# EAGLE schematic esp32_servo_lcd_cam_v6 (EAGLE 9.7.0)
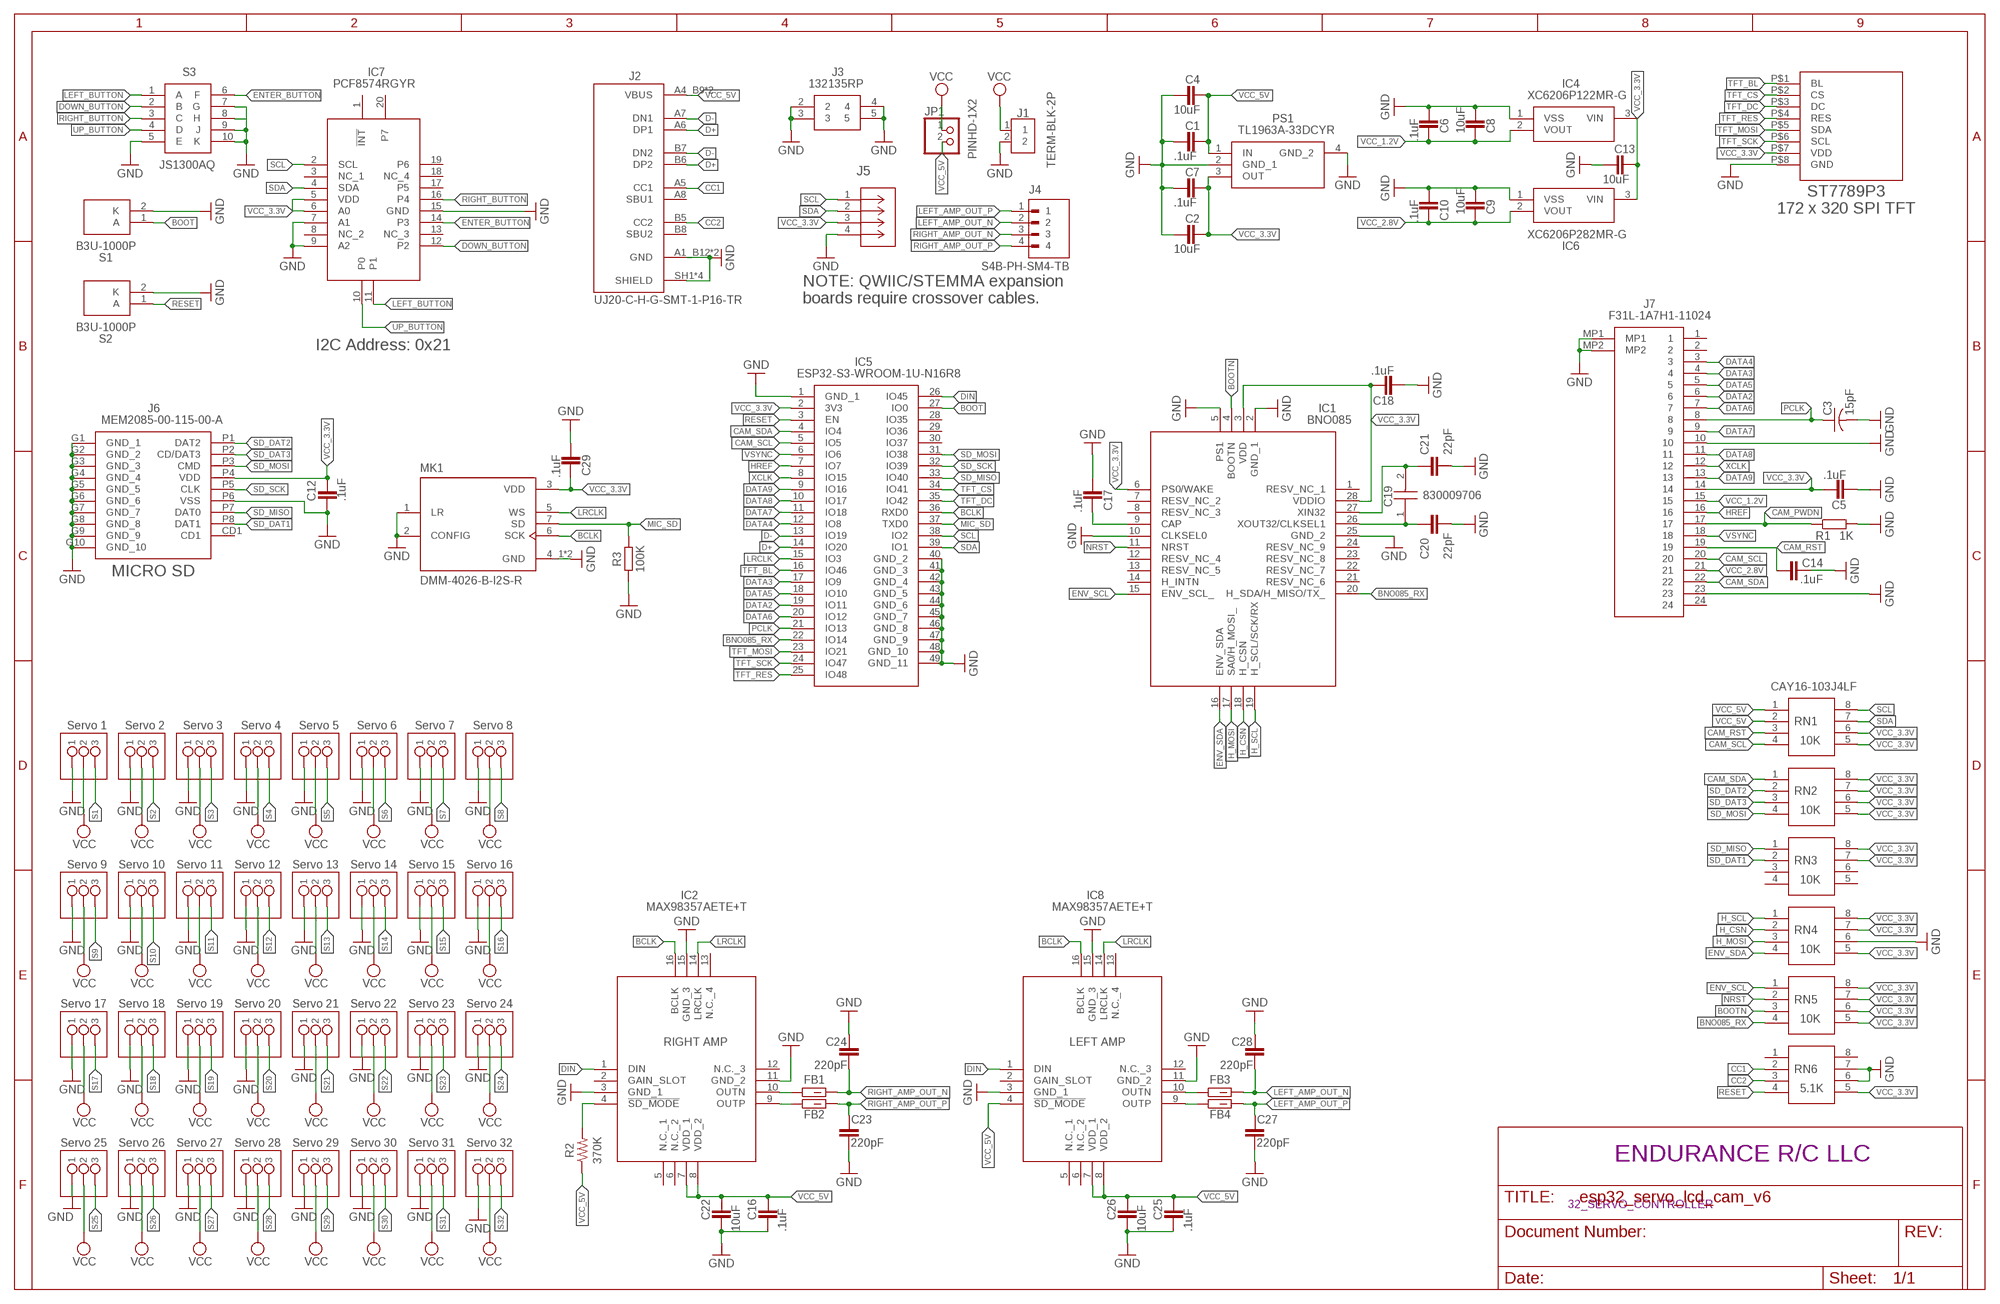
[diagram p0: schematic, sheet 1, part 1 of 2]
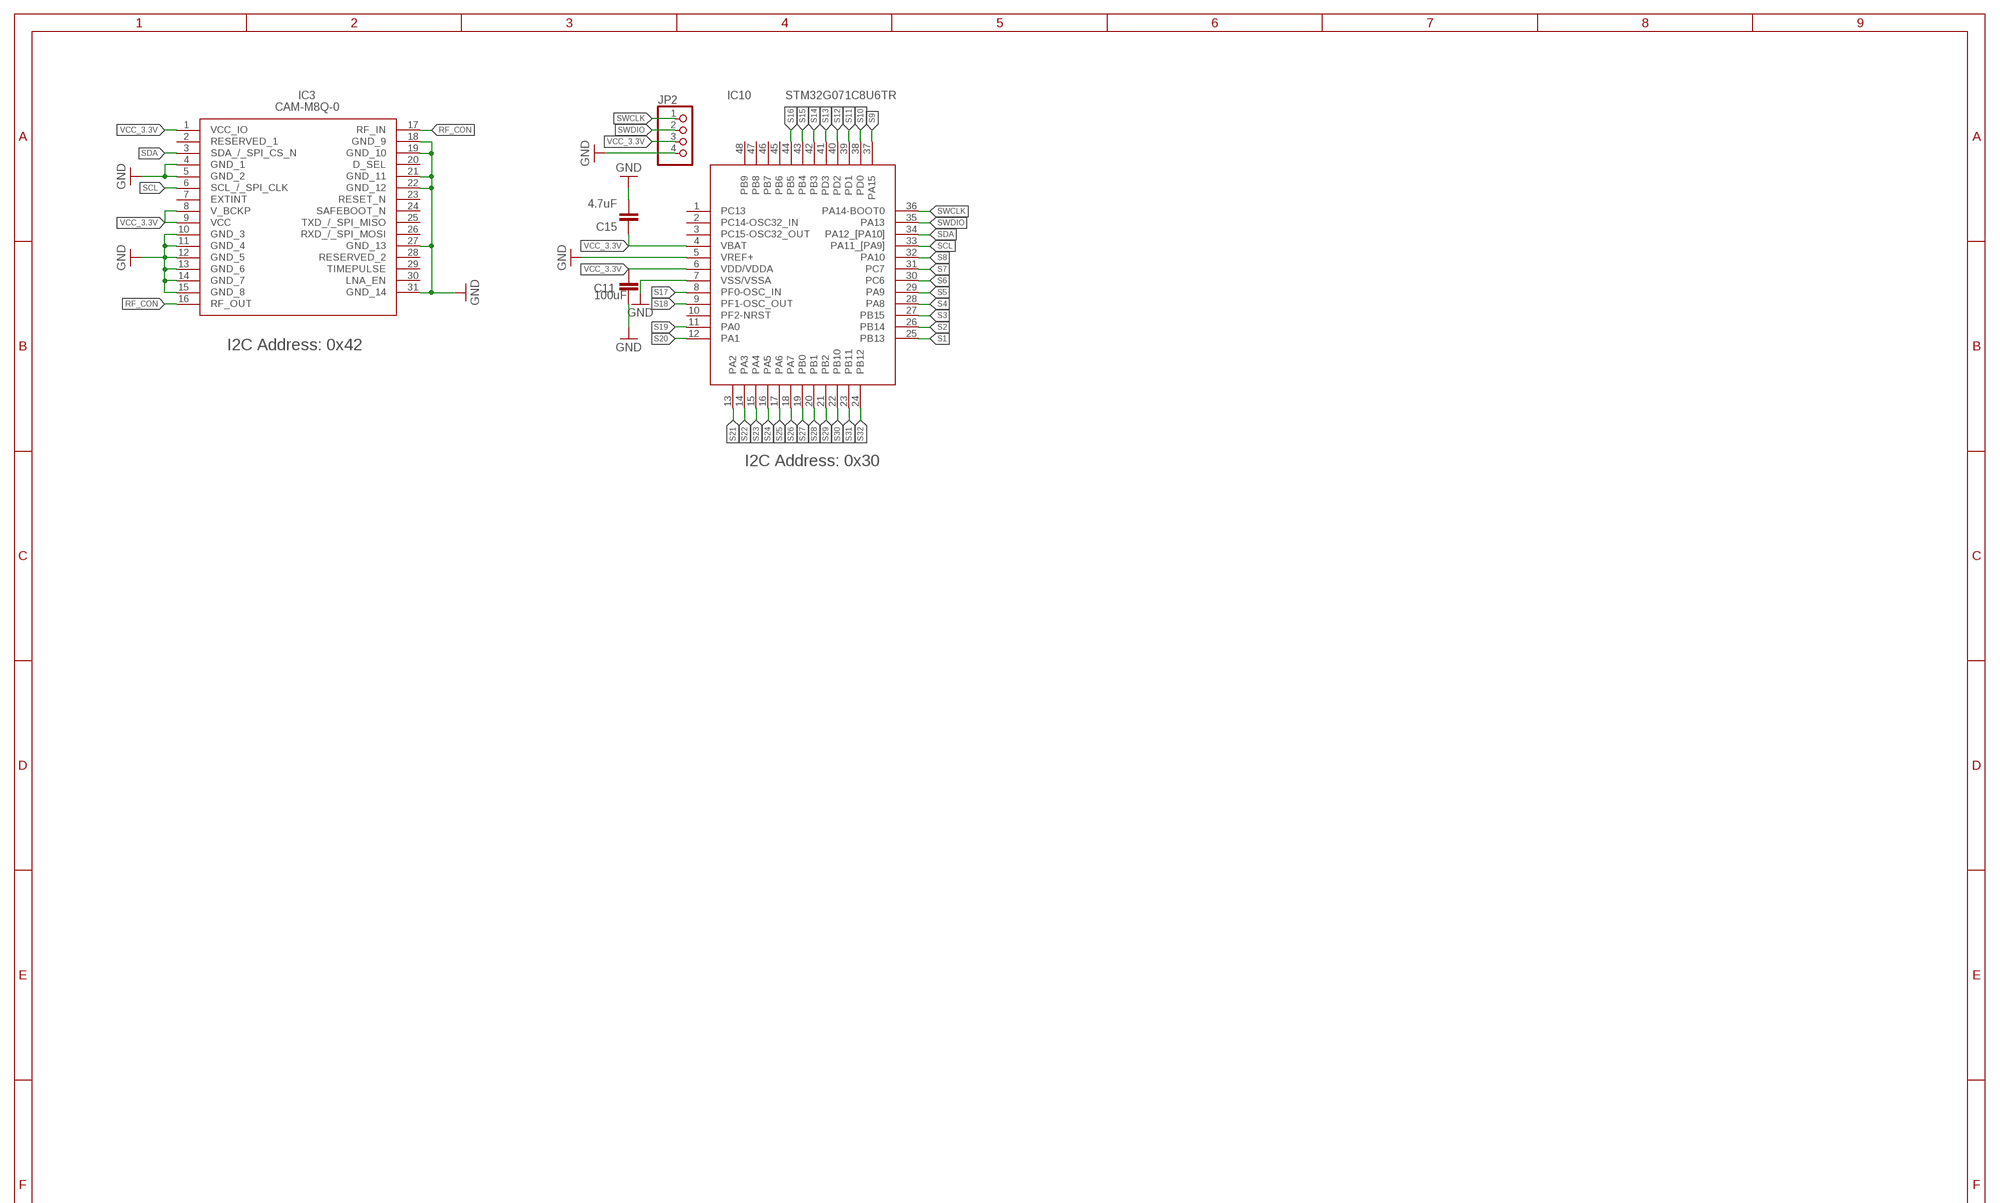
[diagram p1: schematic, sheet 1, part 2 of 2]
FRAME1 (FRAME_B_L): 32_SERVO_CONTROLLER: 1; ENDURANCE_RC_LLC: ENDURANCE R/C LLC
FRAME2 (FRAME_B_L): 32_SERVO_CONTROLLER: 1; ENDURANCE_RC_LLC: ENDURANCE R/C LLC

## Parts
C1  .1uF  CAPACITOR_CHIP-0504(1310-METRIC)  [CAPC1110X102]
C2  10uF  CAPACITOR_CHIP-0504(1310-METRIC)  [CAPC1110X102]
C3  15pF  C-US_CHIP-0805(2012-METRIC)  [CAPC2012X110]
C4  10uF  CAPACITOR_CHIP-0504(1310-METRIC)  [CAPC1110X102]
C5  .1uF  CAPACITOR_CHIP-0504(1310-METRIC)  [CAPC1110X102]
C6  .1uF  CAPACITOR_CHIP-0504(1310-METRIC)  [CAPC1110X102]
C7  .1uF  CAPACITOR_CHIP-0504(1310-METRIC)  [CAPC1110X102]
C8  10uF  CAPACITOR_CHIP-0504(1310-METRIC)  [CAPC1110X102]
C9  10uF  CAPACITOR_CHIP-0504(1310-METRIC)  [CAPC1110X102]
C10  .1uF  CAPACITOR_CHIP-0504(1310-METRIC)  [CAPC1110X102]
C11  100uF  CAPACITOR_CHIP-1210(3225-METRIC)  [CAPC3225X135]
C12  .1uF  CAPACITOR_CHIP-0504(1310-METRIC)  [CAPC1110X102]
C13  10uF  CAPACITOR_CHIP-0504(1310-METRIC)  [CAPC1110X102]
C14  .1uF  CAPACITOR_CHIP-0504(1310-METRIC)  [CAPC1110X102]
C15  4.7uF  C_CHIP-0402(1005-METRIC)  [CAPC1005X60]
C16  .1uF  CAPACITOR_CHIP-0504(1310-METRIC)  [CAPC1110X102]
C17  .1uF  CAPACITOR_CHIP-0504(1310-METRIC)  [CAPC1110X102]
C18  .1uF  CAPACITOR_CHIP-0504(1310-METRIC)  [CAPC1110X102]
C19  830009706  [830009706]
C20  22pF  C_CHIP-0402(1005-METRIC)  [CAPC1005X60]
C21  22pF  C_CHIP-0402(1005-METRIC)  [CAPC1005X60]
C22  10uF  CAPACITOR_CHIP-0504(1310-METRIC)  [CAPC1110X102]
C23  220pF  C_CHIP-0402(1005-METRIC)  [CAPC1005X60]
C24  220pF  C_CHIP-0402(1005-METRIC)  [CAPC1005X60]
C25  .1uF  CAPACITOR_CHIP-0504(1310-METRIC)  [CAPC1110X102]
C26  10uF  CAPACITOR_CHIP-0504(1310-METRIC)  [CAPC1110X102]
C27  220pF  C_CHIP-0402(1005-METRIC)  [CAPC1005X60]
C28  220pF  C_CHIP-0402(1005-METRIC)  [CAPC1005X60]
C29  .1uF  CAPACITOR_CHIP-0504(1310-METRIC)  [CAPC1110X102]
FB1  LM18AG601  FB_BLM18AG601SN1D_0603(1608)  [BEADC1608X95N]
FB2  LM18AG601  FB_BLM18AG601SN1D_0603(1608)  [BEADC1608X95N]
FB3  LM18AG601  FB_BLM18AG601SN1D_0603(1608)  [BEADC1608X95N]
FB4  LM18AG601  FB_BLM18AG601SN1D_0603(1608)  [BEADC1608X95N]
IC1  BNO085  [BNO085]
IC2  MAX98357AETE+T  [QFN50P300X300X80-17N]
IC3  CAM-M8Q-0  [CAMM8Q0]
IC4  XC6206P122MR-G  [SOT95P280X130-3N]
IC5  ESP32-S3-WROOM-1U-N16R8  [ESP32S3WROOM1UN16R8]
IC6  XC6206P282MR-G  [SOT95P280X130-3N]
IC7  PCF8574RGYR  [SN74CB3Q3244RGYR]
IC8  MAX98357AETE+T  [QFN50P300X300X80-17N]
IC10  STM32G071C8U6TR  [QFN50P700X700X65-49N]
J1  TERM-BLK-2P  2828XX-2282837-2  [TERMBLK_508-2N]
J2  UJ20-C-H-G-SMT-1-P16-TR  [SAMESKY_UJ20-C-H-G-SMT-1-P16-TR]
J3  132135RP  [132135RP]
J4  S4B-PH-SM4-TB  [JST_S4B-PH-SM4-TB]
J5  SM04B-SRSS-TBCONN_SM04B-SRSS-TB_JST  [CONN_SM04B-SRSS-TB_JST]
J6  MEM2085-00-115-00-A  [MEM20850011500A]
J7  F31L-1A7H1-11024  [F31L1A7H111024]
JP1  PINHD-1X2  [1X02]
JP2  PINHD-1X4  [1X04]
MK1  DMM-4026-B-I2S-R  [MIC_DMM-4026-B-I2S-R]
PS1  TL1963A-33DCYR  [SOT230P700X180-4N]
R1  1K  R_CHIP-0603(1608-METRIC)  [RESC1608X60]
R2  370K  R-US_CHIP-0603(1608-METRIC)  [RESC1608X60]
R3  100K  R_CHIP-0402(1005-METRIC)  [RESC1005X40]
RN1  CAY16-103J4LF  [CAY16151J4LF]
RN2  CAY16-103J4LF  [CAY16151J4LF]
RN3  CAY16-103J4LF  [CAY16151J4LF]
RN4  CAY16-103J4LF  [CAY16151J4LF]
RN5  CAY16-103J4LF  [CAY16151J4LF]
RN6  CAY16-103J4LF  [CAY16151J4LF]
S1  B3U-1000P  [B3U-1000P]
S2  B3U-1000P  [B3U-1000P]
S3  JS1300AQ  [JS1300]
U$1  Servo 6  PINHD-1X03_1X03M  [1X03]
U$2  Servo 7  PINHD-1X03_1X03M  [1X03]
U$3  Servo 8  PINHD-1X03_1X03M  [1X03]
U$4  Servo 9  PINHD-1X03_1X03M  [1X03]
U$5  Servo 10  PINHD-1X03_1X03M  [1X03]
U$6  Servo 11  PINHD-1X03_1X03M  [1X03]
U$7  Servo 12  PINHD-1X03_1X03M  [1X03]
U$8  Servo 13  PINHD-1X03_1X03M  [1X03]
U$9  Servo 14  PINHD-1X03_1X03M  [1X03]
U$10  Servo 15  PINHD-1X03_1X03M  [1X03]
U$11  Servo 4  PINHD-1X03_1X03M  [1X03]
U$12  Servo 5  PINHD-1X03_1X03M  [1X03]
U$13  Servo 1  PINHD-1X03_1X03M  [1X03]
U$14  Servo 3  PINHD-1X03_1X03M  [1X03]
U$15  Servo 2  PINHD-1X03_1X03M  [1X03]
U$16  Servo 16  PINHD-1X03_1X03M  [1X03]
U$17  Servo 17  PINHD-1X03_1X03M  [1X03]
U$18  Servo 18  PINHD-1X03_1X03M  [1X03]
U$19  Servo 19  PINHD-1X03_1X03M  [1X03]
U$20  Servo 21  PINHD-1X03_1X03M  [1X03]
U$21  Servo 20  PINHD-1X03_1X03M  [1X03]
U$22  Servo 22  PINHD-1X03_1X03M  [1X03]
U$23  Servo 23  PINHD-1X03_1X03M  [1X03]
U$24  Servo 24  PINHD-1X03_1X03M  [1X03]
U$25  Servo 25  PINHD-1X03_1X03M  [1X03]
U$26  Servo 26  PINHD-1X03_1X03M  [1X03]
U$27  Servo 27  PINHD-1X03_1X03M  [1X03]
U$28  Servo 28  PINHD-1X03_1X03M  [1X03]
U$29  Servo 29  PINHD-1X03_1X03M  [1X03]
U$30  Servo 30  PINHD-1X03_1X03M  [1X03]
U$31  Servo 31  PINHD-1X03_1X03M  [1X03]
U$32  Servo 32  PINHD-1X03_1X03M  [1X03]
U$33  1.47_IN_TFT_172_320_ST7789P3  [1.47_IN_TFT_172_320_ST7789P3]

## Nets
BCLK: IC2.16(BCLK) IC5.36(RXD0) IC8.16(BCLK) MK1.6(SCK)
BNO085_RX: IC1.20(H_SDA/H_MISO/TX_) IC5.22(IO14) RN5.4
BOOT: IC5.27(IO0) S1.1(A)
BOOTN: IC1.4(BOOTN) RN5.3
CAM_PWDN: J7.17 R1.1
CAM_RST: C14.1 J7.19 RN1.3
CAM_SCL: IC5.5(IO5) J7.20 RN1.4
CAM_SDA: IC5.4(IO4) J7.22 RN2.1
CC1: J2.A5(CC1) RN6.2
CC2: J2.B5(CC2) RN6.3
D+: IC5.14(IO20) J2.A6(DP1) J2.B6(DP2)
D-: IC5.13(IO19) J2.A7(DN1) J2.B7(DN2)
DATA2: IC5.19(IO11) J7.6
DATA3: IC5.17(IO9) J7.4
DATA4: IC5.12(IO8) J7.3
DATA5: IC5.18(IO10) J7.5
DATA6: IC5.20(IO12) J7.7
DATA7: IC5.11(IO18) J7.9
DATA8: IC5.10(IO17) J7.11
DATA9: IC5.9(IO16) J7.13
DIN: IC2.1(DIN) IC5.26(IO45) IC8.1(DIN)
DOWN_BUTTON: IC7.12(P2) S3.2(B)
ENTER_BUTTON: IC7.14(P3) S3.6(F)
ENV_SCL: IC1.15(ENV_SCL_) RN5.1
ENV_SDA: IC1.16(ENV_SDA) RN4.4
GND: C1.2 C2.2 C3.2 C4.2 C5.2 C6.2 C7.2 C8.2 C9.2 C10.2 C11.2 C12.2 C13.2 C14.2 C15.2 C16.2 C17.2 C18.2 C20.2 C21.2 C22.2 C23.2 C24.2 C25.2 C26.2 C27.2 C28.2 C29.2 IC1.2(GND_1) IC1.5(PS1) IC1.10(CLKSEL0) IC1.25(GND_2) IC2.3(GND_1) IC2.11(GND_2) IC2.15(GND_3) IC3.4(GND_1) IC3.5(GND_2) IC3.10(GND_3) IC3.11(GND_4) IC3.12(GND_5) IC3.13(GND_6) IC3.14(GND_7) IC3.15(GND_8) IC3.18(GND_9) IC3.19(GND_10) IC3.21(GND_11) IC3.22(GND_12) IC3.27(GND_13) IC3.31(GND_14) IC4.1(VSS) IC5.1(GND_1) IC5.40(GND_2) IC5.41(GND_3) IC5.42(GND_4) IC5.43(GND_5) IC5.44(GND_6) IC5.45(GND_7) IC5.46(GND_8) IC5.47(GND_9) IC5.48(GND_10) IC5.49(GND_11) IC6.1(VSS) IC7.7(A1) IC7.9(A2) IC7.15(GND) IC8.3(GND_1) IC8.11(GND_2) IC8.15(GND_3) IC10.5(VREF+) IC10.7(VSS/VSSA) J1.2 J2.A1_B12(GND) J2.B1_A12(GND) J2.SH1(SHIELD) J2.SH2(SHIELD) J2.SH3(SHIELD) J2.SH4(SHIELD) J3.2 J3.3 J3.4 J3.5 J5.4 J6.G1(GND_1) J6.G2(GND_2) J6.G3(GND_3) J6.G4(GND_4) J6.G5(GND_5) J6.G6(GND_6) J6.G7(GND_7) J6.G8(GND_8) J6.G9(GND_9) J6.G10(GND_10) J6.P6(VSS) J7.10 J7.23 J7.MP1 J7.MP2 JP2.4 MK1.1(LR) MK1.2(CONFIG) MK1.4_1(GND) MK1.4_2(GND) PS1.2(GND_1) PS1.4(GND_2) R1.2 R3.1 RN4.6 RN6.6 RN6.7 S1.2(K) S2.2(K) S3.5(E) S3.7(G) S3.8(H) S3.9(J) S3.10(K) U$1.1 U$2.1 U$3.1 U$4.1 U$5.1 U$6.1 U$7.1 U$8.1 U$9.1 U$10.1 U$11.1 U$12.1 U$13.1 U$14.1 U$15.1 U$16.1 U$17.1 U$18.1 U$19.1 U$20.1 U$21.1 U$22.1 U$23.1 U$24.1 U$25.1 U$26.1 U$27.1 U$28.1 U$29.1 U$30.1 U$31.1 U$32.1 U$33.P$8(GND)
H_CSN: IC1.18(H_CSN) RN4.2
H_MOSI: IC1.17(SA0/H_MOSI_) RN4.3
H_SCL: IC1.19(H_SCL/SCK/RX) RN4.1
HREF: IC5.7(IO7) J7.16
LEFT_AMP_OUT_N: C28.1 FB3.2 J4.2
LEFT_AMP_OUT_P: C27.1 FB4.2 J4.1
LEFT_BUTTON: IC7.11(P1) S3.1(A)
LRCLK: IC2.14(LRCLK) IC5.15(IO3) IC8.14(LRCLK) MK1.5(WS)
MIC_SD: IC5.37(TXD0) MK1.7(SD) R3.2
N$2: FB3.1 IC8.10(OUTN)
N$3: FB4.1 IC8.9(OUTP)
N$5: IC2.4(!SD_MODE) R2.2
N$7: FB1.1 IC2.10(OUTN)
N$8: FB2.1 IC2.9(OUTP)
N$12: C17.1 IC1.9(CAP)
N$13: C19.2 C21.1 IC1.27(XIN32)
N$14: C19.1 C20.1 IC1.26(XOUT32/CLKSEL1)
NRST: IC1.11(NRST) RN5.2
PCLK: C3.1 IC5.21(IO13) J7.8
RESET: IC5.3(EN) RN6.4 S2.1(A)
RF_CON: IC3.16(RF_OUT) IC3.17(RF_IN)
RIGHT_AMP_OUT_N: C24.1 FB1.2 J4.3
RIGHT_AMP_OUT_P: C23.1 FB2.2 J4.4
RIGHT_BUTTON: IC7.16(P4) S3.3(C)
S1: IC10.25(PB13) U$13.3
S2: IC10.26(PB14) U$15.3
S3: IC10.27(PB15) U$14.3
S4: IC10.28(PA8) U$11.3
S5: IC10.29(PA9) U$12.3
S6: IC10.30(PC6) U$1.3
S7: IC10.31(PC7) U$2.3
S8: IC10.32(PA10) U$3.3
S9: IC10.37(PA15) U$4.3
S10: IC10.38(PD0) U$5.3
S11: IC10.39(PD1) U$6.3
S12: IC10.40(PD2) U$7.3
S13: IC10.41(PD3) U$8.3
S14: IC10.42(PB3) U$9.3
S15: IC10.43(PB4) U$10.3
S16: IC10.44(PB5) U$16.3
S17: IC10.8(PF0-OSC_IN) U$17.3
S18: IC10.9(PF1-OSC_OUT) U$18.3
S19: IC10.11(PA0) U$19.3
S20: IC10.12(PA1) U$21.3
S21: IC10.13(PA2) U$20.3
S22: IC10.14(PA3) U$22.3
S23: IC10.15(PA4) U$23.3
S24: IC10.16(PA5) U$24.3
S25: IC10.17(PA6) U$25.3
S26: IC10.18(PA7) U$26.3
S27: IC10.19(PB0) U$27.3
S28: IC10.20(PB1) U$28.3
S29: IC10.21(PB2) U$29.3
S30: IC10.22(PB10) U$30.3
S31: IC10.23(PB11) U$31.3
S32: IC10.24(PB12) U$32.3
SCL: IC3.6(SCL_/_SPI_CLK) IC5.38(IO2) IC7.2(SCL) IC10.33(PA11_[PA9]) J5.1 RN1.8
SD_DAT1: J6.P8(DAT1) RN3.2
SD_DAT2: J6.P1(DAT2) RN2.2
SD_DAT3: J6.P2(CD/DAT3) RN2.3
SD_MISO: IC5.33(IO40) J6.P7(DAT0) RN3.1
SD_MOSI: IC5.31(IO38) J6.P3(CMD) RN2.4
SD_SCK: IC5.32(IO39) J6.P5(CLK)
SDA: IC3.3(SDA_/_SPI_CS_N) IC5.39(IO1) IC7.4(SDA) IC10.34(PA12_[PA10]) J5.2 RN1.7
SWCLK: IC10.36(PA14-BOOT0) JP2.1
SWDIO: IC10.35(PA13) JP2.2
TFT_BL: IC5.16(IO46) U$33.P$1(BL)
TFT_CS: IC5.34(IO41) U$33.P$2(CS)
TFT_DC: IC5.35(IO42) U$33.P$3(DC)
TFT_MOSI: IC5.23(IO21) U$33.P$5(SDA)
TFT_RES: IC5.25(IO48) U$33.P$4(RES)
TFT_SCK: IC5.24(IO47) U$33.P$6(SCL)
UP_BUTTON: IC7.10(P0) S3.4(D)
VCC: J1.1 JP1.1 U$1.2 U$2.2 U$3.2 U$4.2 U$5.2 U$6.2 U$7.2 U$8.2 U$9.2 U$10.2 U$11.2 U$12.2 U$13.2 U$14.2 U$15.2 U$16.2 U$17.2 U$18.2 U$19.2 U$20.2 U$21.2 U$22.2 U$23.2 U$24.2 U$25.2 U$26.2 U$27.2 U$28.2 U$29.2 U$30.2 U$31.2 U$32.2
VCC_1.2V: C6.1 C8.1 IC4.2(VOUT) J7.15
VCC_2.8V: C9.1 C10.1 IC6.2(VOUT) J7.21
VCC_3.3V: C2.1 C5.1 C7.1 C11.1 C12.1 C13.1 C15.1 C18.1 C29.1 IC1.3(VDD) IC1.6(PS0/WAKE) IC1.28(VDDIO) IC3.1(VCC_IO) IC3.8(V_BCKP) IC3.9(VCC) IC4.3(VIN) IC5.2(3V3) IC6.3(VIN) IC7.5(VDD) IC7.6(A0) IC10.4(VBAT) IC10.6(VDD/VDDA) J5.3 J6.P4(VDD) J7.14 JP2.3 MK1.3(VDD) PS1.3(OUT) RN1.5 RN1.6 RN2.5 RN2.6 RN2.7 RN2.8 RN3.7 RN3.8 RN4.5 RN4.7 RN4.8 RN5.5 RN5.6 RN5.7 RN5.8 RN6.5 U$33.P$7(VDD)
VCC_5V: C1.1 C4.1 C16.1 C22.1 C25.1 C26.1 IC2.7(VDD_1) IC2.8(VDD_2) IC8.4(!SD_MODE) IC8.7(VDD_1) IC8.8(VDD_2) J2.A4_B9(VBUS) J2.B4_A9(VBUS) JP1.2 PS1.1(IN) R2.1 RN1.1 RN1.2
VSYNC: IC5.6(IO6) J7.18
XCLK: IC5.8(IO15) J7.12
Unconnected: IC1.1(RESV_NC_1) IC1.7(RESV_NC_2) IC1.8(RESV_NC_3) IC1.12(RESV_NC_4) IC1.13(RESV_NC_5) IC1.14(H_INTN) IC1.21(RESV_NC_6) IC1.22(RESV_NC_7) IC1.23(RESV_NC_8) IC1.24(RESV_NC_9) IC2.2(GAIN_SLOT) IC2.5(N.C._1) IC2.6(N.C._2) IC2.12(N.C._3) IC2.13(N.C._4) IC3.2(RESERVED_1) IC3.7(EXTINT) IC3.20(D_SEL) IC3.23(RESET_N) IC3.24(SAFEBOOT_N) IC3.25(TXD_/_SPI_MISO) IC3.26(RXD_/_SPI_MOSI) IC3.28(RESERVED_2) IC3.29(TIMEPULSE) IC3.30(LNA_EN) IC5.28(IO35) IC5.29(IO36) IC5.30(IO37) IC7.1(!INT) IC7.3(NC_1) IC7.8(NC_2) IC7.13(NC_3) IC7.17(P5) IC7.18(NC_4) IC7.19(P6) IC7.20(P7) IC8.2(GAIN_SLOT) IC8.5(N.C._1) IC8.6(N.C._2) IC8.12(N.C._3) IC8.13(N.C._4) IC10.1(PC13) IC10.2(PC14-OSC32_IN) IC10.3(PC15-OSC32_OUT) IC10.10(PF2-NRST) IC10.45(PB6) IC10.46(PB7) IC10.47(PB8) IC10.48(PB9) J2.A8(SBU1) J2.B8(SBU2) J6.CD1 J7.1 J7.2 J7.24 RN3.3 RN3.4 RN3.5 RN3.6 RN6.1 RN6.8

## Notes on the sheet
- ST7789P3
  172 x 320 SPI TFT
- NOTE: QWIIC/STEMMA expansion
  boards require crossover cables.
- I2C Address: 0x21
- MICRO SD
- 10K
- 10K
- 10K
- 10K
- 10K
- RIGHT AMP | LEFT AMP
- 5.1K
- I2C Address: 0x42
- I2C Address: 0x30

## Library data of the parts
C1 C2 C4-C14 C16-C18 C22 C25 C26 C29 = Tinkercad:CAPACITOR: Capacitor - Generic; CATEGORY: Capacitor
C3 = Capacitor:C-US: Capacitor - ANSI; CATEGORY: Capacitor
C15 C20 C21 C23 C24 C27 C28 = Capacitor:C: Capacitor - Generic; CATEGORY: Capacitor
C19 = 830009706:830009706: WE-XTAL Quartz Crystal CFPX-217; 3.2 x 1.5mm; 32.7680 kHz; Tol = +/-20 ppm; Stab = +/-- ppm Load Cap = 9 pF; Source: Datasheet <https://www.we-online.com/catalog/datasheet/830009706.pdf>; DESCRIPTION: WE-XTAL Quartz Crystal CFPX-217; 3.2 x 1.5mm; 32.7680 kHz; Tol = +/-20 ppm; Stab = +/-- ppm Load Cap = 9 pF;; HEIGHT: 0.9mm; MANUFACTURER_NAME: Wurth Elektronik; MANUFACTURER_PART_NUMBER: 830009706; MOUSER_PART_NUMBER: 710-830009706; MOUSER_PRICE-STOCK: https://www.mouser.co.uk/ProductDetail/Wurth-Elektronik/830009706?qs=2WXlatMagcFmeMIz1Bq3%2Fg%3D%3D
FB1-FB4 = Filter:FB_: Ferrite Bead - Popular parts; CATEGORY: Filter; DESCRIPTION: FERRITE BEAD 600 OHM 0603 1LN; MANUFACTURER: Murata Electronics; SUB-CATEGORY: Ferrite bead
IC1 = BNO085:BNO085: Board Mount Motion & Position Sensors 9-axis IMU Source: Datasheet <https://www.ceva-dsp.com/wp-content/uploads/2019/10/BNO080_085-Datasheet.pdf>; DESCRIPTION: Board Mount Motion & Position Sensors 9-axis IMU; HEIGHT: 1.18mm; MANUFACTURER_NAME: CEVA; MANUFACTURER_PART_NUMBER: BNO085; MOUSER_PART_NUMBER: 526-BNO085; MOUSER_PRICE-STOCK: https://www.mouser.co.uk/ProductDetail/CEVA/BNO085?qs=ulEaXIWI0c9BFVeZDQCmmQ%3D%3D
IC2 IC8 = MAX98357AETE+T:MAX98357AETE+T: Audio Amplifiers Digital Input Class D Amplifier Source: Datasheet <https://datasheets.maximintegrated.com/en/ds/MAX98357A-MAX98357B.pdf>; DESCRIPTION: Audio Amplifiers Digital Input Class D Amplifier; HEIGHT: 0.8mm; MANUFACTURER_NAME: Analog Devices; MANUFACTURER_PART_NUMBER: MAX98357AETE+T; MOUSER_PART_NUMBER: 700-MAX98357AETE+T; MOUSER_PRICE-STOCK: https://www.mouser.co.uk/ProductDetail/Analog-Devices-Maxim-Integrated/MAX98357AETE%2bT?qs=AAveGqk956HhNpoJjF5x2g%3D%3D
IC3 = CAM-M8Q-0:CAM-M8Q-0: CAM-M8 RF Receiver BeiDou, GLONASS, GNSS, GPS, QZSS 1.575GHz -167dBm On-Board, Chip Module Source: Datasheet <https://content.u-blox.com/sites/default/files/CAM-M8-FW3_DataSheet_(UBX-15031574).pdf>; DESCRIPTION: CAM-M8 RF Receiver BeiDou, GLONASS, GNSS, GPS, QZSS 1.575GHz -167dBm On-Board, Chip Module; HEIGHT: 2.3mm; MANUFACTURER_NAME: u-blox; MANUFACTURER_PART_NUMBER: CAM-M8Q-0; MOUSER_PART_NUMBER: 377-CAM-M8Q-0; MOUSER_PRICE-STOCK: https://www.mouser.co.uk/ProductDetail/u-blox/CAM-M8Q-0?qs=vEM7xhTegWgOVMjXYnonQA%3D%3D
IC4 = XC6206P122MR-G:XC6206P122MR-G: LDO Voltage Regulators 1uA Low Quiescent 3 Terminal, Low ESR Cap. Compatible, Voltage Regulator Source: Datasheet <https://www.torexsemi.com/file/xc6206/XC6206.pdf>; DESCRIPTION: LDO Voltage Regulators 1uA Low Quiescent 3 Terminal, Low ESR Cap. Compatible, Voltage Regulator; HEIGHT: 1.3mm; MANUFACTURER_NAME: Torex; MANUFACTURER_PART_NUMBER: XC6206P122MR-G; MOUSER_PART_NUMBER: 865-XC6206P122MR-G; MOUSER_PRICE-STOCK: https://www.mouser.co.uk/ProductDetail/Torex-Semiconductor/XC6206P122MR-G?qs=AsjdqWjXhJ%2F35%2FU%2FZk2JYg%3D%3D
IC5 = ESP32-S3-WROOM-1U-N16R8:ESP32-S3-WROOM-1U-N16R8: WiFi Modules - 802.11 [Engineering Samples] SMD Module, ESP32-S3R8, 8 MB Octal PSRAM Die, 16 MB Quad SPI Flash, IPEX Antenna Connector Source: Datasheet <https://www.espressif.com/sites/default/files/documentation/esp32-s3-wroom-1_wroom-1u_datasheet_en.pdf>; DESCRIPTION: WiFi Modules - 802.11 [Engineering Samples] SMD Module, ESP32-S3R8, 8 MB Octal PSRAM Die, 16 MB Quad SPI Flash, IPEX Antenna Connector; HEIGHT: 3.35mm; MANUFACTURER_NAME: Espressif Systems; MANUFACTURER_PART_NUMBER: ESP32-S3-WROOM-1U-N16R8; MOUSER_PART_NUMBER: 356-ESP32S3WM1UN16R8; MOUSER_PRICE-STOCK: https://www.mouser.co.uk/ProductDetail/Espressif-Systems/ESP32-S3-WROOM-1U-N16R8?qs=Li%252BoUPsLEns6V0Pr5KRJtw%3D%3D
IC6 = XC6206P282MR-G:XC6206P282MR-G: LDO Voltage Regulators 1uA Low Quiescent 3 Terminal, Low ESR Cap. Compatible, Voltage Regulator Source: Datasheet <https://www.torexsemi.com/file/xc6206/XC6206.pdf>; DESCRIPTION: LDO Voltage Regulators 1uA Low Quiescent 3 Terminal, Low ESR Cap. Compatible, Voltage Regulator; HEIGHT: 1.3mm; MANUFACTURER_NAME: Torex; MANUFACTURER_PART_NUMBER: XC6206P282MR-G; MOUSER_PART_NUMBER: 865-XC6206P282MR-G; MOUSER_PRICE-STOCK: https://www.mouser.co.uk/ProductDetail/Torex-Semiconductor/XC6206P282MR-G?qs=AsjdqWjXhJ%2Fpd3DOBopSeA%3D%3D
IC7 = PCF8574RGYR:PCF8574RGYR: Texas Instruments PCF8574RGYR, 8-channel 8bit I/O Expander 100kHz, I2C, 20-Pin VQFN Source: Datasheet <http://www.ti.com/lit/gpn/pcf8574>; DESCRIPTION: Texas Instruments PCF8574RGYR, 8-channel 8bit I/O Expander 100kHz, I2C, 20-Pin VQFN; HEIGHT: 1mm; MANUFACTURER_NAME: Texas Instruments; MANUFACTURER_PART_NUMBER: PCF8574RGYR; MOUSER_PART_NUMBER: 595-PCF8574RGYR; MOUSER_PRICE-STOCK: https://www.mouser.co.uk/ProductDetail/Texas-Instruments/PCF8574RGYR?qs=wgAEGBTxy7kR2T7hhFxD0g%3D%3D
IC10 = STM32G071C8U6TR:STM32G071C8U6TR: Arm Cortex-M0+ 32-bit MCU, up to 128 KB Flash, 36 KB RAM, 4x USART, timers, ADC, DAC, comm. I/Fs, 1.7-3.6V Source: Datasheet <https://www.st.com/resource/en/datasheet/stm32g071c8.pdf>; DESCRIPTION: Arm Cortex-M0+ 32-bit MCU, up to 128 KB Flash, 36 KB RAM, 4x USART, timers, ADC, DAC, comm. I/Fs, 1.7-3.6V; HEIGHT: 0.65mm; MANUFACTURER_NAME: STMicroelectronics; MANUFACTURER_PART_NUMBER: STM32G071C8U6TR; MOUSER_PART_NUMBER: 511-STM32G071C8U6TR; MOUSER_PRICE-STOCK: https://www.mouser.co.uk/ProductDetail/STMicroelectronics/STM32G071C8U6TR?qs=l7cgNqFNU1jLAVhkp9RJiw%3D%3D
J1 = Connector:2828XX-2: 2 Position Wire to Board Terminal Block Horizontal with Board Datasheet <https://www.te.com.cn/commerce/DocumentDelivery/DDEController?Action=showdoc&DocId=Catalog+Section%7F1308389_EUROSTYLE_TERMINAL_BLOCKS%7F0607%7Fpdf%7FEnglish%7FENG_CS_1308389_EUROSTYLE_TERMINAL_BLOCKS_0607.pdf%7F2-282837-5>; CATEGORY: Fixed Terminal Blocks; DESCRIPTION: Fixed Terminal Blocks 5.08MM PCB MOUNT 2P; MANUFACTURER: TE Connectivity AMP Connectors; MPN: 282837-2; OPERATING_TEMPERATURE: -40°C to +105°C; PART_STATUS: ACTIVE; PITCH: 0.200" (5.08mm); ROHS_COMPLIANCE: RoHS Compliant; SERIES: Buchanan; SUBCATEGORY: Terminal Blocks; TYPE: Through Hole; Screw - Rising Cage Clamp; Side wire entry, Horizontal with Board
J2 = UJ20-C-H-G-SMT-1-P16-TR:UJ20-C-H-G-SMT-1-P16-TR; MANUFACTURER: Same Sky; MAXIMUM_PACKAGE_HEIGHT: 3.46mm; PARTREV: 1.0; STANDARD: Manufacturer Recommendations
J3 = 132135RP:132135RP: CONN RP-SMA PLUG R/A 50 OHM PCB Source: Datasheet <https://datasheet.datasheetarchive.com/originals/distributors/Datasheets-DGA15/760984.pdf>; DESCRIPTION: CONN RP-SMA PLUG R/A 50 OHM PCB; HEIGHT: 9.86mm; MANUFACTURER_NAME: Amphenol; MANUFACTURER_PART_NUMBER: 132135RP; MOUSER_PART_NUMBER: 523-132135RP; MOUSER_PRICE-STOCK: https://www.mouser.co.uk/ProductDetail/Amphenol-RF/132135RP?qs=Ld4zsxSTIA5ZJk%2F2qgahKQ%3D%3D
J4 = S4B-PH-SM4-TB:S4B-PH-SM4-TB: Check availability <https://pricing.snapeda.com/parts/S4B-PH-SM4-TB/JST%20Sales/view-part?ref=eda>; AVAILABILITY: In Stock; CHECK_PRICES: https://www.snapeda.com/parts/S4B-PH-SM4-TB/JST/view-part/?ref=eda; DESCRIPTION: Connector Header Surface Mount, Right Angle 4 position 0.079 (2.00mm); MF: JST Sales; MP: S4B-PH-SM4-TB; PACKAGE: None; PRICE: None; SNAPEDA_LINK: https://www.snapeda.com/parts/S4B-PH-SM4-TB/JST/view-part/?ref=snap
J5 = 2026-07-14_02-46-40_Library:SM04B-SRSS-TB; COPYRIGHT: Copyright (C) 2026 Ultra Librarian. All rights reserved.; DIGI-KEY_PART_NUMBER_1: 455-1422-2-ND; DIGI-KEY_PART_NUMBER_2: 455-1422-1-ND; MANUFACTURER_NAME: JST; MANUFACTURER_PART_NUMBER: SM04B-SRSS-TB
J6 = MEM2085-00-115-00-A:MEM2085-00-115-00-A: Memory Card Connectors Micro SD Push Pull SMT 1.15mm No Peg Source: Datasheet <https://gct.co/files/drawings/mem2085.pdf>; DESCRIPTION: Memory Card Connectors Micro SD Push Pull SMT 1.15mm No Peg; HEIGHT: 1.35mm; MANUFACTURER_NAME: GCT (GLOBAL CONNECTOR TECHNOLOGY); MANUFACTURER_PART_NUMBER: MEM2085-00-115-00-A; MOUSER_PART_NUMBER: 640-MEM20850011500A; MOUSER_PRICE-STOCK: https://www.mouser.co.uk/ProductDetail/GCT/MEM2085-00-115-00-A?qs=rQFj71Wb1eWNkFUhuuvVIA%3D%3D
J7 = F31L-1A7H1-11024:F31L-1A7H1-11024: Flex Connector, 0.50mm Pitch, Height 2.55mm, Right angle, Flip type, ZIF, 24 position , With MYLAR Source: Datasheet <https://cdn.amphenol-cs.com/media/wysiwyg/files/drawing/a-s0099-lf31l.pdf>; DESCRIPTION: Flex Connector, 0.50mm Pitch, Height 2.55mm, Right angle, Flip type, ZIF, 24 position , With MYLAR; HEIGHT: 2.75mm; MANUFACTURER_NAME: Amphenol; MANUFACTURER_PART_NUMBER: F31L-1A7H1-11024; MOUSER_PART_NUMBER: 649-F31L-1A7H1-11024; MOUSER_PRICE-STOCK: https://www.mouser.co.uk/ProductDetail/Amphenol-Aorora/F31L-1A7H1-11024?qs=xZ%2FP%252Ba9zWqYLk4%2F4aeCtBg%3D%3D
JP1 = Connector:PINHD-1X2: PIN HEADER; CATEGORY: Headers; DESCRIPTION: Header, Straight, 2 Position; MANUFACTURER: Generic; MPN: Generic; OPERATING_TEMPERATURE: Generic; PART_STATUS: Active; PITCH: 0.100" (2.54mm); ROHS_COMPLIANCE: Generic; SERIES: Generic; SUB-CATEGORY: Headers, Male Pins; TYPE: Board to Board or Cable, Unshrouded, Through Hole, Straight
JP2 = Connector:PINHD-1X4: PIN HEADER; CATEGORY: Headers; DESCRIPTION: Header, Straight, 4 Position; MANUFACTURER: Generic; MPN: Generic; OPERATING_TEMPERATURE: Generic; PART_STATUS: Active; PITCH: 0.100" (2.54mm); ROHS_COMPLIANCE: Generic; SERIES: Generic; SUB-CATEGORY: Headers, Male Pins; TYPE: Board to Board or Cable, Unshrouded, Through Hole, Straight
MK1 = DMM-4026-B-I2S-R:DMM-4026-B-I2S-R; CREATOR: KARTHIK; MANUFACTURER: PUI Audio; MAXIMUM_PACKAGE_HEIGHT: 1 mm; PARTREV: A; STANDARD: Manufacturer Recommendations; UNIT: mm
PS1 = TL1963A-33DCYR:TL1963A-33DCYR: 1.5-A Low-Noise Fast-Transient-Response Low-Dropout Regulator Source: Datasheet <http://www.ti.com/lit/gpn/tl1963a>; DESCRIPTION: 1.5-A Low-Noise Fast-Transient-Response Low-Dropout Regulator; HEIGHT: 1.8mm; MANUFACTURER_NAME: Texas Instruments; MANUFACTURER_PART_NUMBER: TL1963A-33DCYR; MOUSER_PART_NUMBER: 595-TL1963A-33DCYR; MOUSER_PRICE-STOCK: https://www.mouser.co.uk/ProductDetail/Texas-Instruments/TL1963A-33DCYR?qs=IK5e5L0zOXhRu%2FNTAfJNEA%3D%3D
R1 R3 = Resistor:R: Resistor Fixed - Generic; CATEGORY: Resistor; SUB-CATEGORY: Fixed
R2 = Resistor:R-US: Resistor Fixed - ANSI; CATEGORY: Resistor; SUB-CATEGORY: Fixed
RN1-RN6 = CAY16-103J4LF:CAY16-103J4LF: 4-array convex 0603 LF resistor,10K Bourns CAY16 Series 10k +/-5% Isolated SMT Resistor Array, 4 Resistors, 0.25W total 1206 package Convex Source: Datasheet <https://componentsearchengine.com/Datasheets/2/CAY16-103J4LF.pdf>; DESCRIPTION: 4-array convex 0603 LF resistor,10K Bourns CAY16 Series 10k +/-5% Isolated SMT Resistor Array, 4 Resistors, 0.25W total 1206 package Convex; HEIGHT: 0.6mm; MANUFACTURER_NAME: Bourns; MANUFACTURER_PART_NUMBER: CAY16-103J4LF; MOUSER_PART_NUMBER: 652-CAY16-103J4LF; MOUSER_PRICE-STOCK: https://www.mouser.co.uk/ProductDetail/Bourns/CAY16-103J4LF?qs=6yLoizYthp5P0DFw3TvYqA%3D%3D
S1 S2 = B3U-1000P:B3U-1000P: OMRON ELECTRONIC COMPONENTS - B3U-1000P - SWITCH, SPST-NO, 0.05A, 12V, SMD Source: Datasheet <https://www.omron.com/ecb/products/pdf/en-b3u.pdf>; DESCRIPTION: OMRON ELECTRONIC COMPONENTS - B3U-1000P - SWITCH, SPST-NO, 0.05A, 12V, SMD; HEIGHT: mm; MANUFACTURER_NAME: OMRON Electronics; MANUFACTURER_PART_NUMBER: B3U-1000P; MOUSER_PART_NUMBER: 653-B3U-1000P; MOUSER_PRICE-STOCK: https://www.mouser.co.uk/ProductDetail/Omron-Electronics/B3U-1000P?qs=AO7BQMcsEu4ip80xyf2FwA%3D%3D
S3 = JS1300AQ:JS1300AQ: ANTI-VANDAL, No Internal Switch Contacts, Pilot Indicator Panel Mount, Front Source: Datasheet <https://configured-product-images.s3.amazonaws.com/2D/specs/5501M21.pdf>; DESCRIPTION: ANTI-VANDAL, No Internal Switch Contacts, Pilot Indicator Panel Mount, Front; HEIGHT: mm; MANUFACTURER_NAME: E-Switch; MANUFACTURER_PART_NUMBER: JS1300AQ; MOUSER_PART_NUMBER: 612-JS1300AQ; MOUSER_PRICE-STOCK: https://www.mouser.co.uk/ProductDetail/E-Switch/JS1300AQ?qs=cyOInwlKnRNRSQbl9aaldA%3D%3D
U$1-U$32 = Tinkercad:PINHD-1X03
U$33 = TFT_Library:1.47_IN_TFT_172_320_ST7789P3